# EAGLE schematic ce_hdd_v40 (EAGLE 6.2)
Assembly variants: ACSI, SCSI

## Sheet 1 of 5: IKBD part
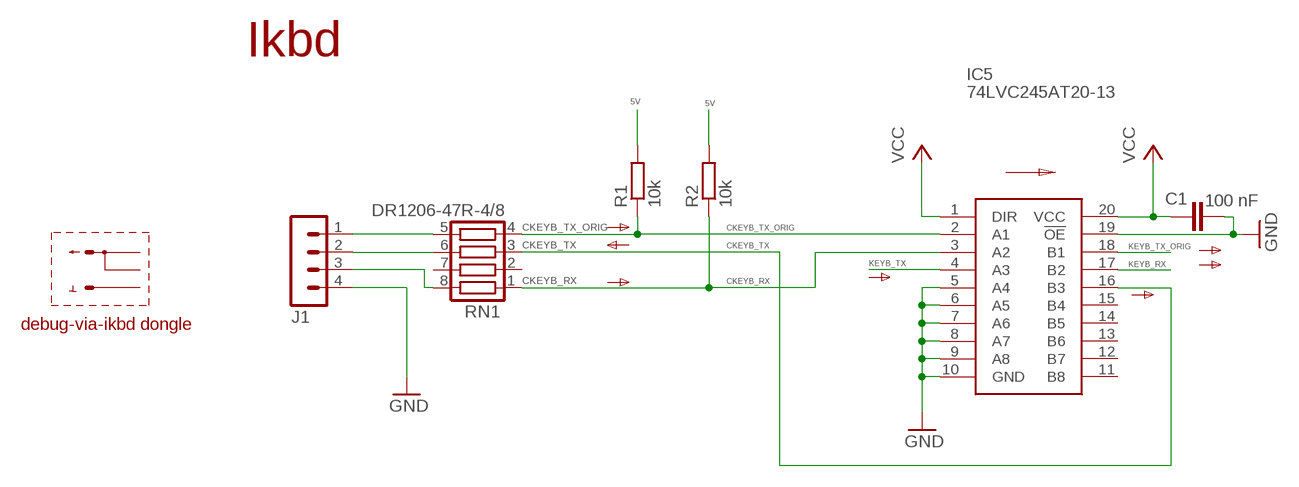
[diagram p0: schematic, sheet 1]

### Parts
C1  100 nF  C-EUC0603  [C0603]
IC5  74LVC245AT20-13  [SOP65P640X120-20N]
J1  MA04-1  [MA04-1]
R1  10k  R-EU_R0603  [R0603]
R2  10k  R-EU_R0603  [R0603]
RN1  DR1206-47R-4/8  CTS742C083  [CTS742C083]

### Nets
5V: R1.2 R2.2 ; also sheet 3,5
CKEYB_RX: IC5.3(A2) R2.1 RN1.1
CKEYB_TX: IC5.16(B3) RN1.3
CKEYB_TX_ORIG: IC5.2(A1) R1.1 RN1.4
GND: C1.1 IC5.5(A4) IC5.6(A5) IC5.7(A6) IC5.8(A7) IC5.9(A8) IC5.10(GND) IC5.19(!OE) J1.4 ; also sheet 2,3,4,5
KEYB_RX: IC5.17(B2) ; also sheet 5
KEYB_TX: IC5.4(A3) ; also sheet 5
KEYB_TX_ORIG: IC5.18(B1) ; also sheet 5
N$21: J1.2 RN1.6
VCC: C1.2 IC5.1(DIR) IC5.20(VCC) ; also sheet 2,4,5
ZKEYB_RX: J1.3 RN1.8
ZKEYB_TX_ORIG: J1.1 RN1.5
Unconnected: IC5.11(B8) IC5.12(B7) IC5.13(B6) IC5.14(B5) IC5.15(B4) RN1.2 RN1.7

### Notes on the sheet
- Ikbd
- debug-via-ikbd dongle

## Sheet 2 of 5: SCSI drivers and termination
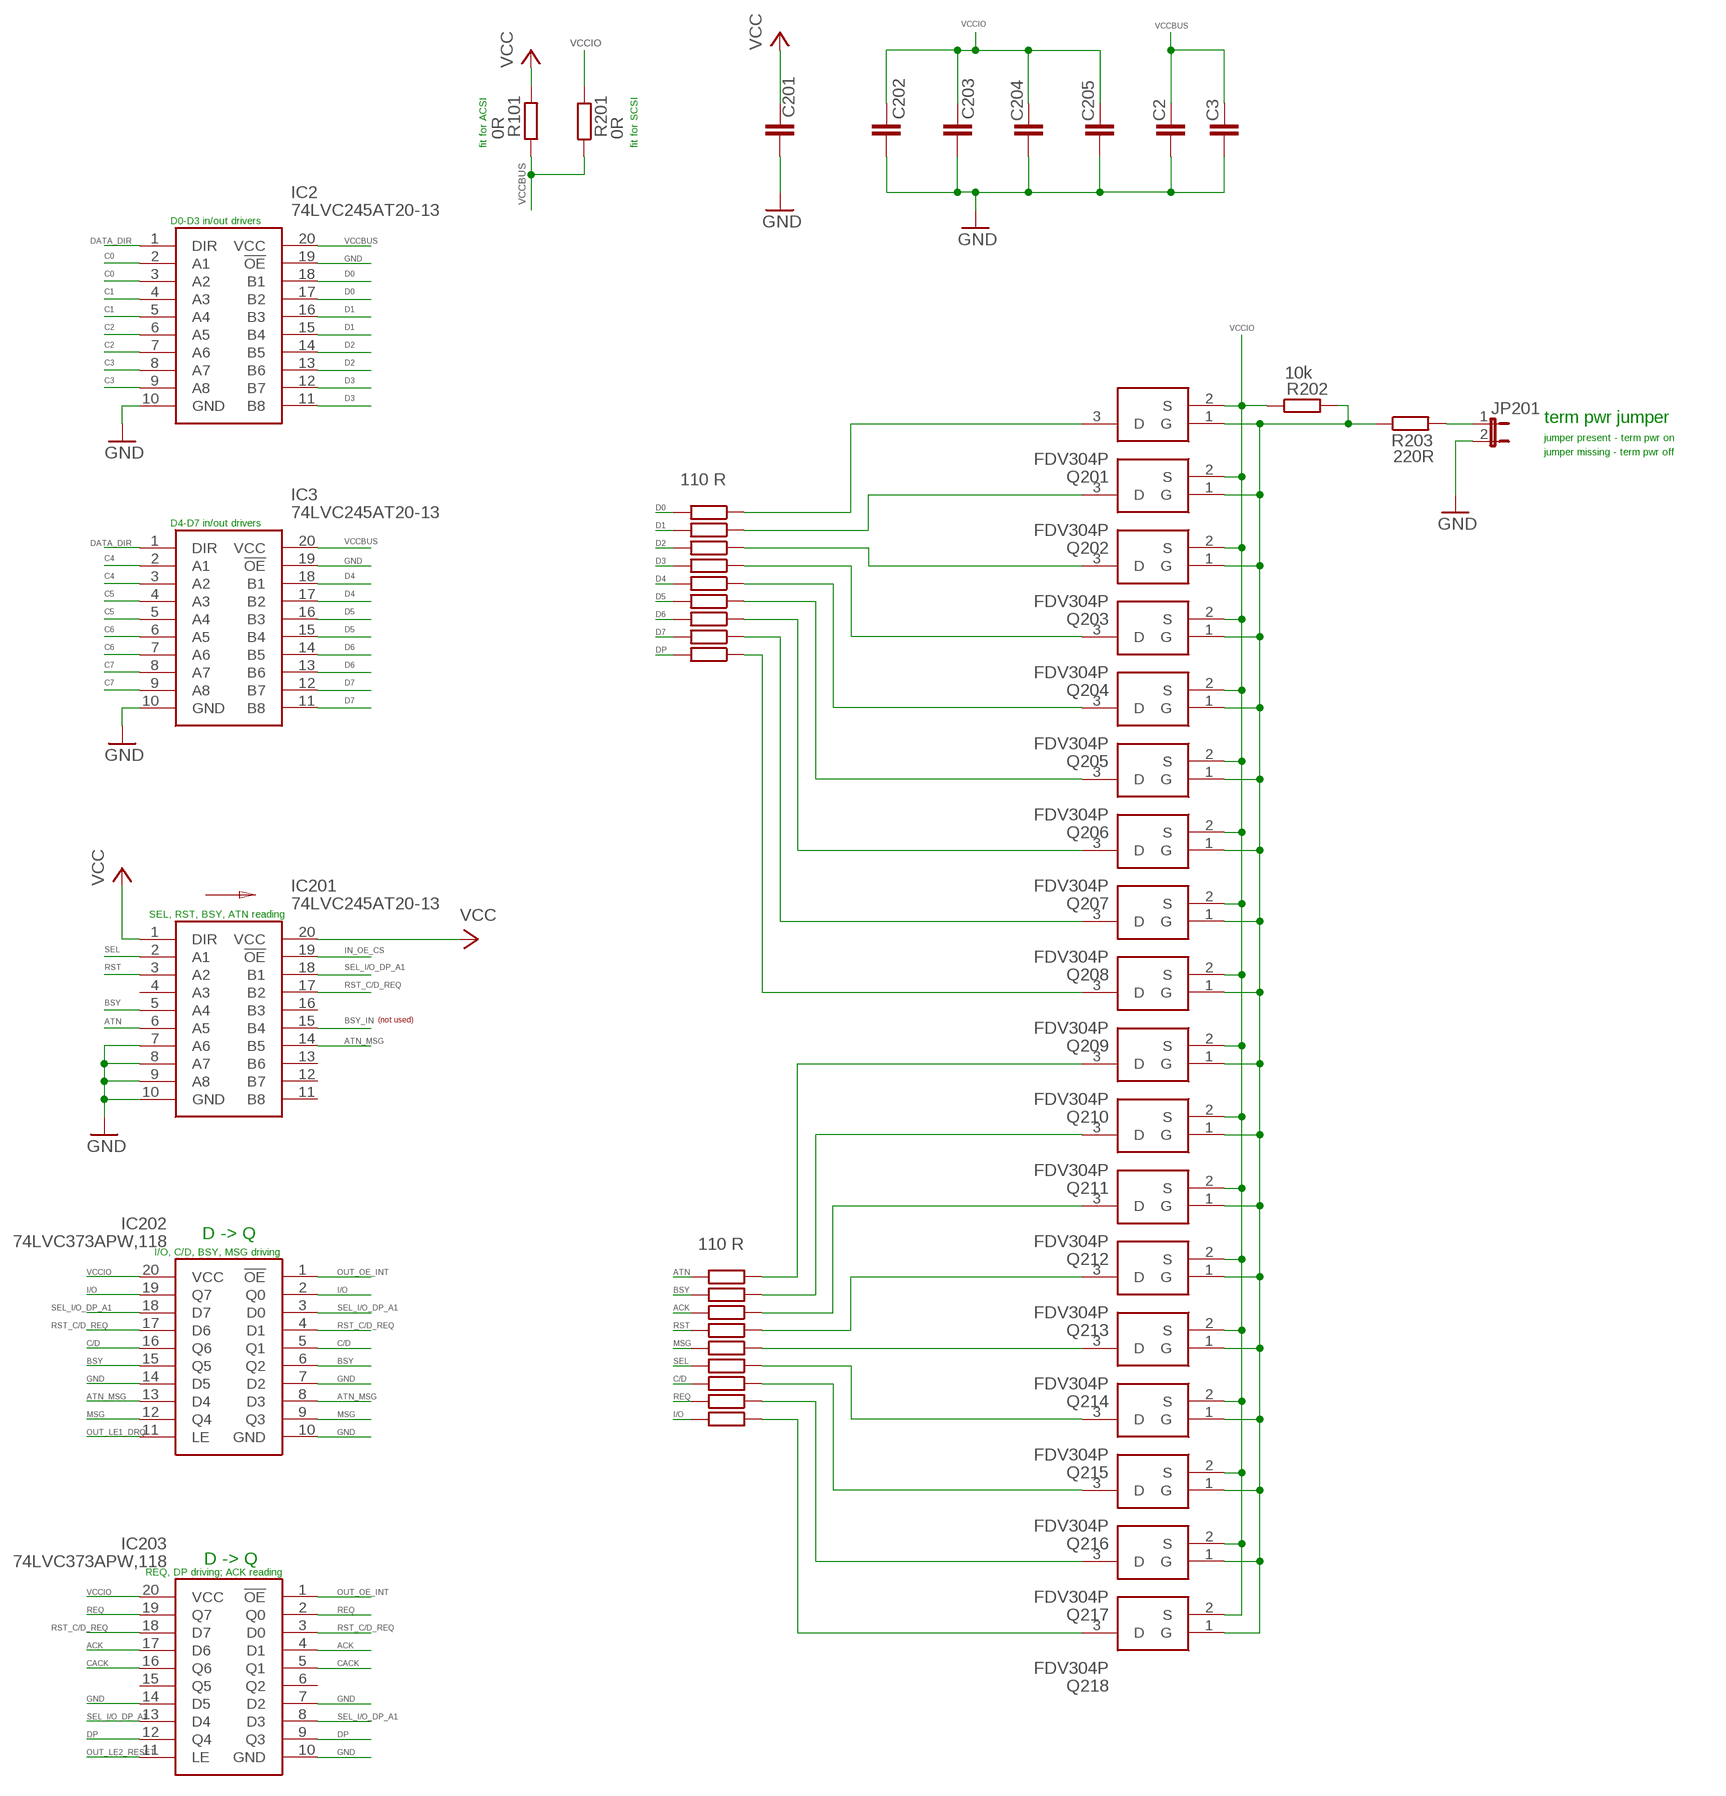
[diagram p1: schematic, sheet 2]

### Parts
C2  100 nF  C-EUC0603  [C0603]
C3  100 nF  C-EUC0603  [C0603]
C201  100 nF  C-EUC0603  [C0603]  (not fitted in variant ACSI)
C202  100 nF  C-EUC0603  [C0603]  (not fitted in variant ACSI)
C203  1 uF  C-EUC0603  [C0603]  (not fitted in variant ACSI)
C204  100 nF  C-EUC0603  [C0603]  (not fitted in variant ACSI)
C205  100 nF  C-EUC0603  [C0603]  (not fitted in variant ACSI)
IC2  74LVC245AT20-13  [SOP65P640X120-20N]
IC3  74LVC245AT20-13  [SOP65P640X120-20N]
IC201  74LVC245AT20-13  [SOP65P640X120-20N]  (not fitted in variant ACSI)
IC202  74LVC373APW,118  [SOP65P640X110-20N]  (not fitted in variant ACSI)
IC203  74LVC373APW,118  [SOP65P640X110-20N]  (not fitted in variant ACSI)
JP201  JP1E  [JP1]  (not fitted in variant ACSI)
Q201  FDV304P  IRLML6401TRPBF  [SOT95P237X112-3N]  (not fitted in variant ACSI)
Q202  FDV304P  IRLML6401TRPBF  [SOT95P237X112-3N]  (not fitted in variant ACSI)
Q203  FDV304P  IRLML6401TRPBF  [SOT95P237X112-3N]  (not fitted in variant ACSI)
Q204  FDV304P  IRLML6401TRPBF  [SOT95P237X112-3N]  (not fitted in variant ACSI)
Q205  FDV304P  IRLML6401TRPBF  [SOT95P237X112-3N]  (not fitted in variant ACSI)
Q206  FDV304P  IRLML6401TRPBF  [SOT95P237X112-3N]  (not fitted in variant ACSI)
Q207  FDV304P  IRLML6401TRPBF  [SOT95P237X112-3N]  (not fitted in variant ACSI)
Q208  FDV304P  IRLML6401TRPBF  [SOT95P237X112-3N]  (not fitted in variant ACSI)
Q209  FDV304P  IRLML6401TRPBF  [SOT95P237X112-3N]  (not fitted in variant ACSI)
Q210  FDV304P  IRLML6401TRPBF  [SOT95P237X112-3N]  (not fitted in variant ACSI)
Q211  FDV304P  IRLML6401TRPBF  [SOT95P237X112-3N]  (not fitted in variant ACSI)
Q212  FDV304P  IRLML6401TRPBF  [SOT95P237X112-3N]  (not fitted in variant ACSI)
Q213  FDV304P  IRLML6401TRPBF  [SOT95P237X112-3N]  (not fitted in variant ACSI)
Q214  FDV304P  IRLML6401TRPBF  [SOT95P237X112-3N]  (not fitted in variant ACSI)
Q215  FDV304P  IRLML6401TRPBF  [SOT95P237X112-3N]  (not fitted in variant ACSI)
Q216  FDV304P  IRLML6401TRPBF  [SOT95P237X112-3N]  (not fitted in variant ACSI)
Q217  FDV304P  IRLML6401TRPBF  [SOT95P237X112-3N]  (not fitted in variant ACSI)
Q218  FDV304P  IRLML6401TRPBF  [SOT95P237X112-3N]  (not fitted in variant ACSI)
R101  0R  R-EU_R0603  [R0603]  (not fitted in variant SCSI)
R201  0R  R-EU_R0603  [R0603]  (not fitted in variant ACSI)
R202  10k  R-EU_R0603  [R0603]  (not fitted in variant ACSI)
R203  220R  R-EU_R0603  [R0603]  (not fitted in variant ACSI)
R204  110 R  R-EU_R0603  [R0603]  (not fitted in variant ACSI)
R205  110 R  R-EU_R0603  [R0603]  (not fitted in variant ACSI)
R206  110 R  R-EU_R0603  [R0603]  (not fitted in variant ACSI)
R207  110 R  R-EU_R0603  [R0603]  (not fitted in variant ACSI)
R208  110 R  R-EU_R0603  [R0603]  (not fitted in variant ACSI)
R209  110 R  R-EU_R0603  [R0603]  (not fitted in variant ACSI)
R210  110 R  R-EU_R0603  [R0603]  (not fitted in variant ACSI)
R211  110 R  R-EU_R0603  [R0603]  (not fitted in variant ACSI)
R212  110 R  R-EU_R0603  [R0603]  (not fitted in variant ACSI)
R213  110 R  R-EU_R0603  [R0603]  (not fitted in variant ACSI)
R214  110 R  R-EU_R0603  [R0603]  (not fitted in variant ACSI)
R215  110 R  R-EU_R0603  [R0603]  (not fitted in variant ACSI)
R216  110 R  R-EU_R0603  [R0603]  (not fitted in variant ACSI)
R217  110 R  R-EU_R0603  [R0603]  (not fitted in variant ACSI)
R218  110 R  R-EU_R0603  [R0603]  (not fitted in variant ACSI)
R219  110 R  R-EU_R0603  [R0603]  (not fitted in variant ACSI)
R220  110 R  R-EU_R0603  [R0603]  (not fitted in variant ACSI)
R221  110 R  R-EU_R0603  [R0603]  (not fitted in variant ACSI)

### Nets
AAAA: Q201.3(D) R204.1
ACK: IC203.4(D1) IC203.17(D6) R215.2 ; also sheet 3
ATN: IC201.6(A5) R213.2 ; also sheet 3
ATN_MSG: IC201.14(B5) IC202.8(D3) IC202.13(D4) ; also sheet 5
BSY: IC201.5(A4) IC202.6(Q2) IC202.15(Q5) R214.2 ; also sheet 3
BSY_IN: IC201.15(B4)
C0: IC2.2(A1) IC2.3(A2) ; also sheet 5
C1: IC2.4(A3) IC2.5(A4) ; also sheet 5
C2: IC2.6(A5) IC2.7(A6) ; also sheet 5
C3: IC2.8(A7) IC2.9(A8) ; also sheet 5
C4: IC3.2(A1) IC3.3(A2) ; also sheet 5
C5: IC3.4(A3) IC3.5(A4) ; also sheet 5
C6: IC3.6(A5) IC3.7(A6) ; also sheet 5
C7: IC3.8(A7) IC3.9(A8) ; also sheet 5
C/D: IC202.5(Q1) IC202.16(Q6) R219.2 ; also sheet 3
CACK: IC203.5(Q1) IC203.16(Q6) ; also sheet 4,5
D0: IC2.17(B2) IC2.18(B1) R204.2 ; also sheet 3,4
D1: IC2.15(B4) IC2.16(B3) R205.2 ; also sheet 3,4
D2: IC2.13(B6) IC2.14(B5) R206.2 ; also sheet 3,4
D3: IC2.11(B8) IC2.12(B7) R207.2 ; also sheet 3,4
D4: IC3.17(B2) IC3.18(B1) R208.2 ; also sheet 3,4
D5: IC3.15(B4) IC3.16(B3) R209.2 ; also sheet 3,4
D6: IC3.13(B6) IC3.14(B5) R210.2 ; also sheet 3,4
D7: IC3.11(B8) IC3.12(B7) R211.2 ; also sheet 3,4
DATA_DIR: IC2.1(DIR) IC3.1(DIR) ; also sheet 5
DP: IC203.9(Q3) IC203.12(Q4) R212.2 ; also sheet 3
GND: C2.2 C3.2 C201.2 C202.2 C203.2 C204.2 C205.2 IC2.10(GND) IC2.19(!OE) IC3.10(GND) IC3.19(!OE) IC201.7(A6) IC201.8(A7) IC201.9(A8) IC201.10(GND) IC202.7(D2) IC202.10(GND) IC202.14(D5) IC203.7(D2) IC203.10(GND) IC203.14(D5) JP201.2 ; also sheet 1,3,4,5
I/O: IC202.2(Q0) IC202.19(Q7) R221.2 ; also sheet 3
IN_OE_CS: IC201.19(!OE) ; also sheet 4,5
MSG: IC202.9(Q3) IC202.12(Q4) R217.2 ; also sheet 3
N$8: JP201.1 R203.2
N$12: Q202.3(D) R205.1
N$13: Q203.3(D) R206.1
N$14: Q204.3(D) R207.1
N$15: Q205.3(D) R208.1
N$18: Q206.3(D) R209.1
N$19: Q207.3(D) R210.1
N$20: Q208.3(D) R211.1
N$22: Q209.3(D) R212.1
N$24: Q210.3(D) R213.1
N$100: Q211.3(D) R214.1
N$101: Q212.3(D) R215.1
N$102: Q213.3(D) R216.1
N$103: Q214.3(D) R217.1
N$104: Q215.3(D) R218.1
N$105: Q216.3(D) R219.1
N$106: Q217.3(D) R220.1
N$107: Q218.3(D) R221.1
OUT_LE1_DRQ: IC202.11(LE) ; also sheet 4,5
OUT_LE2_RESET: IC203.11(LE) ; also sheet 4,5
OUT_OE_INT: IC202.1(!OE) IC203.1(!OE) ; also sheet 4,5
REQ: IC203.2(Q0) IC203.19(Q7) R220.2 ; also sheet 3
RST: IC201.3(A2) R216.2 ; also sheet 3
RST_C/D_REQ: IC201.17(B2) IC202.4(D1) IC202.17(D6) IC203.3(D0) IC203.18(D7) ; also sheet 5
SEL: IC201.2(A1) R218.2 ; also sheet 3
SEL_I/O_DP_A1: IC201.18(B1) IC202.3(D0) IC202.18(D7) IC203.8(D3) IC203.13(D4) ; also sheet 4,5
TP_ON: Q201.1(G) Q202.1(G) Q203.1(G) Q204.1(G) Q205.1(G) Q206.1(G) Q207.1(G) Q208.1(G) Q209.1(G) Q210.1(G) Q211.1(G) Q212.1(G) Q213.1(G) Q214.1(G) Q215.1(G) Q216.1(G) Q217.1(G) Q218.1(G) R202.2 R203.1
VCC: C201.1 IC201.1(DIR) IC201.20(VCC) R101.2 ; also sheet 1,4,5
VCCBUS: C2.1 C3.1 IC2.20(VCC) IC3.20(VCC) R101.1 R201.1
VCCIO: C202.1 C203.1 C204.1 C205.1 IC202.20(VCC) IC203.20(VCC) Q201.2(S) Q202.2(S) Q203.2(S) Q204.2(S) Q205.2(S) Q206.2(S) Q207.2(S) Q208.2(S) Q209.2(S) Q210.2(S) Q211.2(S) Q212.2(S) Q213.2(S) Q214.2(S) Q215.2(S) Q216.2(S) Q217.2(S) Q218.2(S) R201.2 R202.1 ; also sheet 3
Unconnected: IC201.4(A3) IC201.11(B8) IC201.12(B7) IC201.13(B6) IC201.16(B3) IC203.6(Q2) IC203.15(Q5)

### Notes on the sheet
- fit for ACSI | fit for SCSI
- D0-D3 in/out drivers
- term pwr jumper
- jumper present - term pwr on
- jumper missing - term pwr off
- D4-D7 in/out drivers
- SEL, RST, BSY, ATN reading
- (not used)
- D -> Q
- I/O, C/D, BSY, MSG driving
- D -> Q
- REQ, DP driving; ACK reading

## Sheet 3 of 5: SCSI connectors
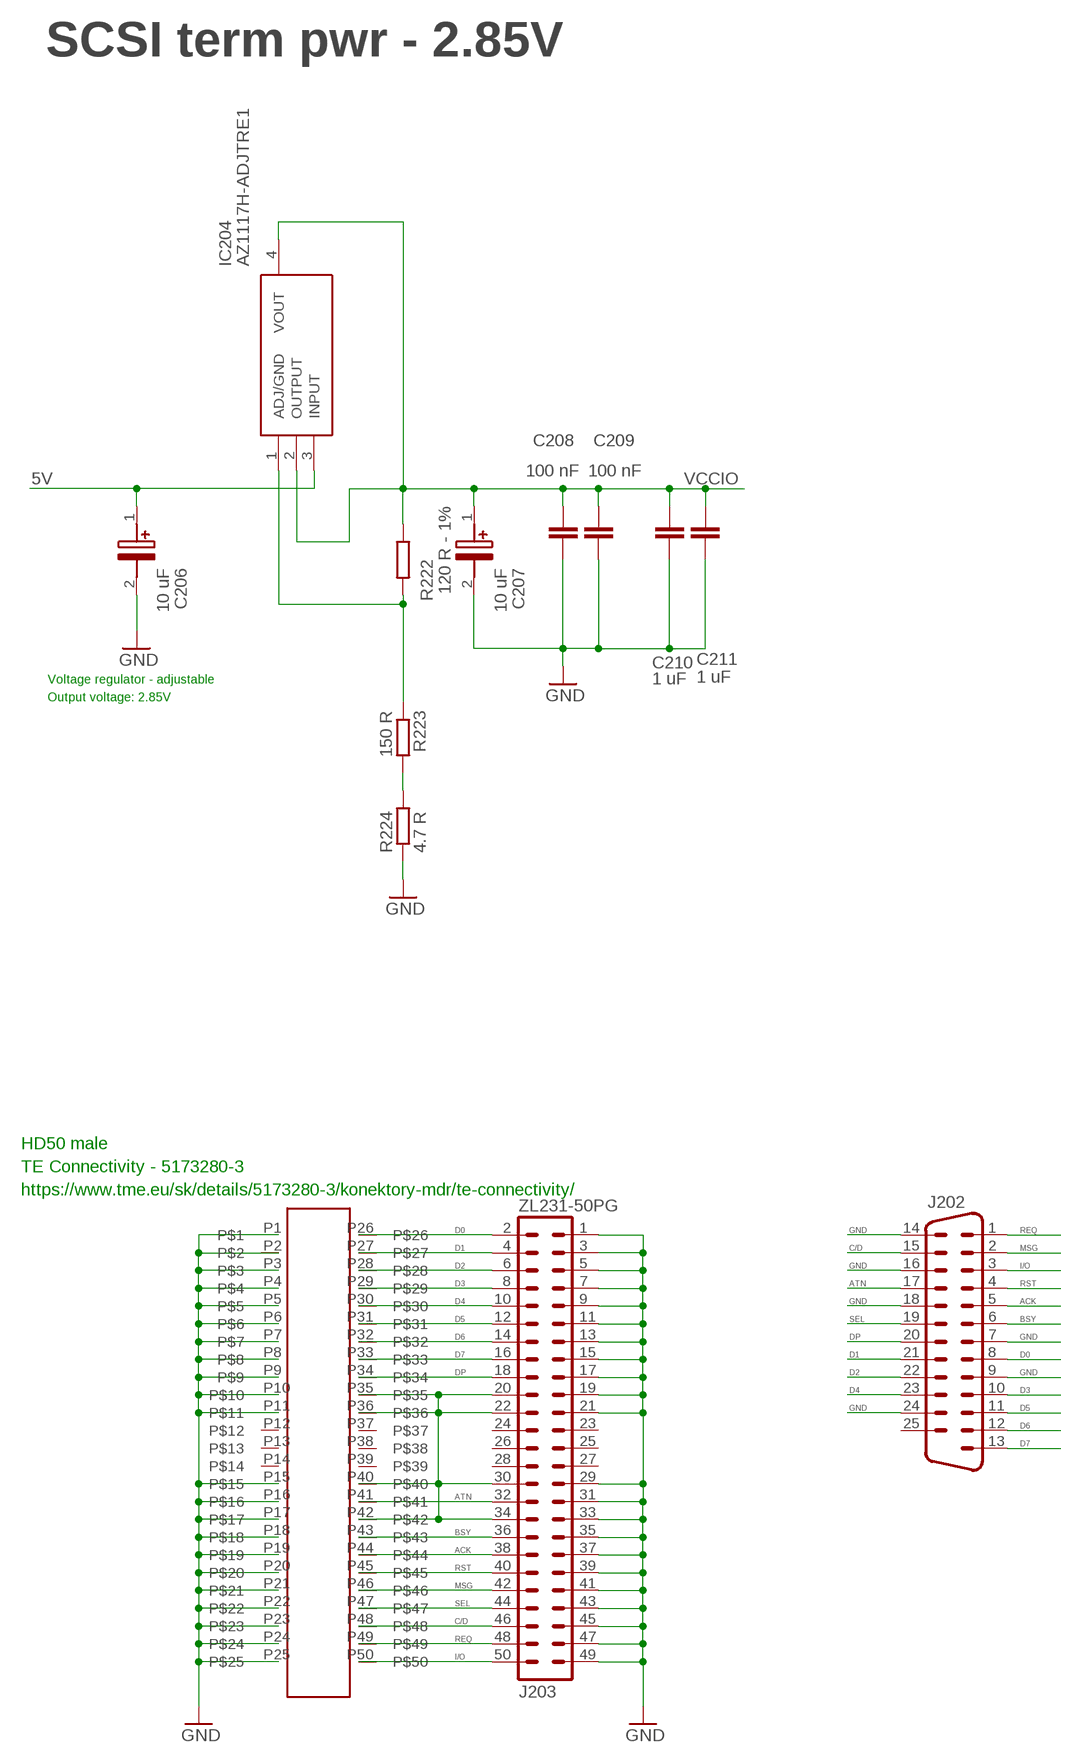
[diagram p2: schematic, sheet 3]

### Parts
C206  10 uF  293D106X9016B2TE3  [CAPPM3528X210N]  (not fitted in variant ACSI)
C207  10 uF  293D106X9016B2TE3  [CAPPM3528X210N]  (not fitted in variant ACSI)
C208  100 nF  C-EUC0603  [C0603]  (not fitted in variant ACSI)
C209  100 nF  C-EUC0603  [C0603]  (not fitted in variant ACSI)
C210  1 uF  C-EUC0603  [C0603]  (not fitted in variant ACSI)
C211  1 uF  C-EUC0603  [C0603]  (not fitted in variant ACSI)
IC204  AZ1117H-ADJTRE1  [SOT230P700X185-4N]  (not fitted in variant ACSI)
J201  TE Connectivity - 5173280-3  HD50_MALE  [HD50_MALE]  (not fitted in variant ACSI)
J202  M25V  [M25V]  (not fitted in variant ACSI)
J203  ZL231-50PG  ML50  [ML50]  (not fitted in variant ACSI)
R222  120 R - 1%  R-EU_R0603  [R0603]  (not fitted in variant ACSI)
R223  150 R  R-EU_R0603  [R0603]  (not fitted in variant ACSI)
R224  4.7 R  R-EU_R0603  [R0603]  (not fitted in variant ACSI)

### Nets
5V: C206.1(+) IC204.3(INPUT) ; also sheet 1,5
ACK: J201.P44 J202.5 J203.38 ; also sheet 2
ATN: J201.P41 J202.17 J203.32 ; also sheet 2
BSY: J201.P43 J202.6 J203.36 ; also sheet 2
C/D: J201.P48 J202.15 J203.46 ; also sheet 2
D0: J201.P26 J202.8 J203.2 ; also sheet 2,4
D1: J201.P27 J202.21 J203.4 ; also sheet 2,4
D2: J201.P28 J202.22 J203.6 ; also sheet 2,4
D3: J201.P29 J202.10 J203.8 ; also sheet 2,4
D4: J201.P30 J202.23 J203.10 ; also sheet 2,4
D5: J201.P31 J202.11 J203.12 ; also sheet 2,4
D6: J201.P32 J202.12 J203.14 ; also sheet 2,4
D7: J201.P33 J202.13 J203.16 ; also sheet 2,4
DP: J201.P34 J202.20 J203.18 ; also sheet 2
GND: C206.2(-) C207.2(-) C208.2 C209.2 C210.2 C211.2 J201.P1 J201.P2 J201.P3 J201.P4 J201.P5 J201.P6 J201.P7 J201.P8 J201.P9 J201.P10 J201.P11 J201.P15 J201.P16 J201.P17 J201.P18 J201.P19 J201.P20 J201.P21 J201.P22 J201.P23 J201.P24 J201.P25 J201.P35 J201.P36 J201.P40 J201.P42 J202.7 J202.9 J202.14 J202.16 J202.18 J202.24 J203.1 J203.3 J203.5 J203.7 J203.9 J203.11 J203.13 J203.15 J203.17 J203.19 J203.20 J203.21 J203.22 J203.29 J203.30 J203.31 J203.33 J203.34 J203.35 J203.37 J203.39 J203.41 J203.43 J203.45 J203.47 J203.49 R224.1 ; also sheet 1,2,4,5
I/O: J201.P50 J202.3 J203.50 ; also sheet 2
MSG: J201.P46 J202.2 J203.42 ; also sheet 2
N$5: R223.2 R224.2
N$30: IC204.1(ADJ/GND) R222.2 R223.1
REQ: J201.P49 J202.1 J203.48 ; also sheet 2
RST: J201.P45 J202.4 J203.40 ; also sheet 2
SEL: J201.P47 J202.19 J203.44 ; also sheet 2
VCCIO: C207.1(+) C208.1 C209.1 C210.1 C211.1 IC204.2(OUTPUT) IC204.4(VOUT) R222.1 ; also sheet 2
Unconnected: J201.P12 J201.P13 J201.P14 J201.P37 J201.P38 J201.P39 J202.25 J203.23 J203.24 J203.25 J203.26 J203.27 J203.28

### Notes on the sheet
- SCSI term pwr - 2.85V
- Voltage regulator - adjustable
- Output voltage: 2.85V
- HD50 male
- TE Connectivity - 5173280-3
- https://www.tme.eu/sk/details/5173280-3/konektory-mdr/te-connectivity/

## Sheet 4 of 5: ACSI driver and connector
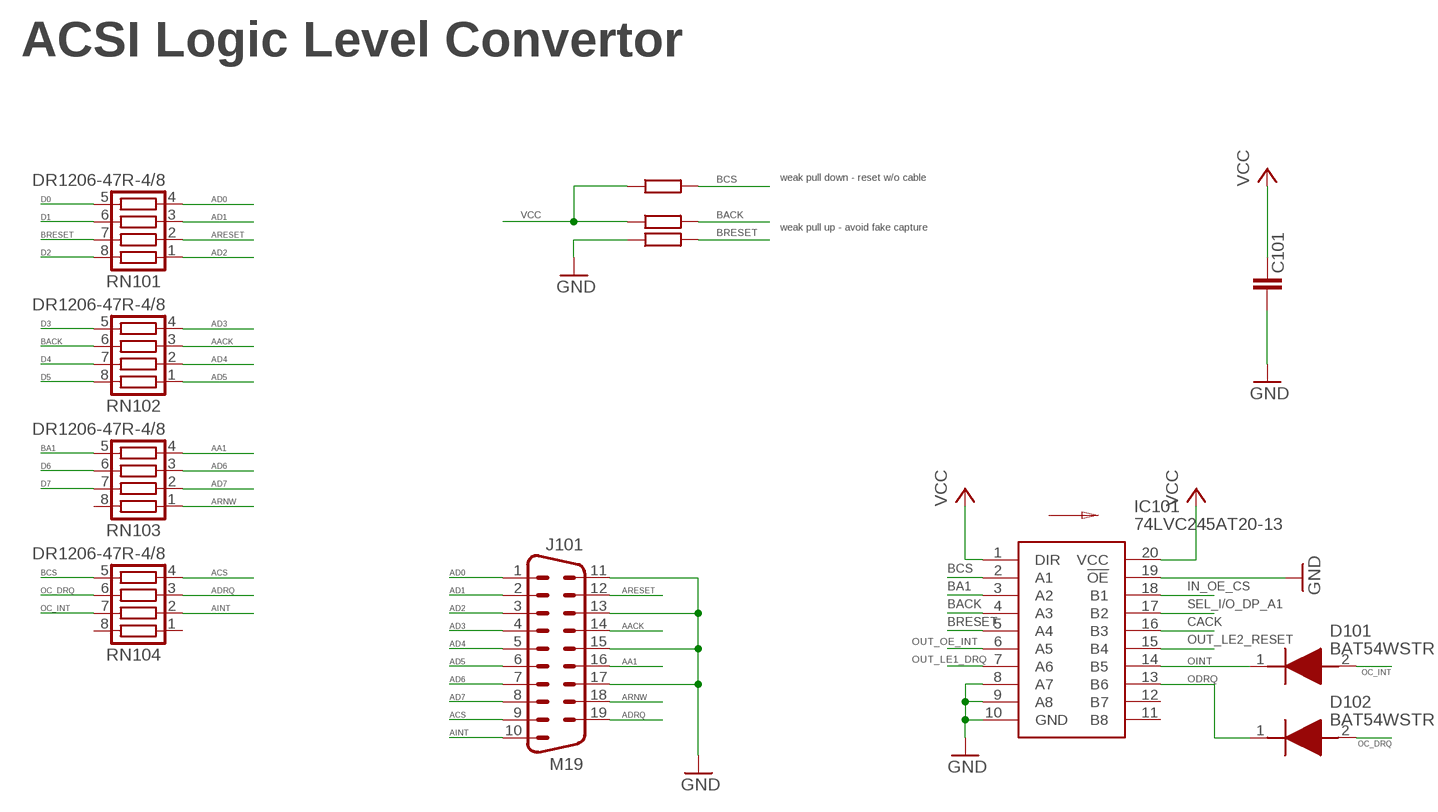
[diagram p3: schematic, sheet 4]

### Parts
C101  1 uF  C-EUC0603  [C0603]  (not fitted in variant SCSI)
D101  BAT54WSTR  [SOD2613X100N]  (not fitted in variant SCSI)
D102  BAT54WSTR  [SOD2613X100N]  (not fitted in variant SCSI)
IC101  74LVC245AT20-13  [SOP65P640X120-20N]  (not fitted in variant SCSI)
J101  M19  [M19]  (not fitted in variant SCSI)
R102  10k  R-EU_R0603  [R0603]  (not fitted in variant SCSI)
R103  10k  R-EU_R0603  [R0603]  (not fitted in variant SCSI)
R104  10k  R-EU_R0603  [R0603]  (not fitted in variant SCSI)
RN101  DR1206-47R-4/8  CTS742C083  [CTS742C083]  (not fitted in variant SCSI)
RN102  DR1206-47R-4/8  CTS742C083  [CTS742C083]  (not fitted in variant SCSI)
RN103  DR1206-47R-4/8  CTS742C083  [CTS742C083]  (not fitted in variant SCSI)
RN104  DR1206-47R-4/8  CTS742C083  [CTS742C083]  (not fitted in variant SCSI)

### Nets
AA1: J101.16 RN103.4
AACK: J101.14 RN102.3
ACS: J101.9 RN104.4
AD0: J101.1 RN101.4
AD1: J101.2 RN101.3
AD2: J101.3 RN101.1
AD3: J101.4 RN102.4
AD4: J101.5 RN102.2
AD5: J101.6 RN102.1
AD6: J101.7 RN103.3
AD7: J101.8 RN103.2
ADRQ: J101.19 RN104.3
AINT: J101.10 RN104.2
ARESET: J101.12 RN101.2
ARNW: J101.18 RN103.1
BA1: IC101.3(A2) RN103.5
BACK: IC101.4(A3) R103.2 RN102.6
BCS: IC101.2(A1) R102.2 RN104.5
BRESET: IC101.5(A4) R104.2 RN101.7
CACK: IC101.16(B3) ; also sheet 2,5
D0: RN101.5 ; also sheet 2,3
D1: RN101.6 ; also sheet 2,3
D2: RN101.8 ; also sheet 2,3
D3: RN102.5 ; also sheet 2,3
D4: RN102.7 ; also sheet 2,3
D5: RN102.8 ; also sheet 2,3
D6: RN103.6 ; also sheet 2,3
D7: RN103.7 ; also sheet 2,3
GND: C101.2 IC101.8(A7) IC101.9(A8) IC101.10(GND) IC101.19(!OE) J101.11 J101.13 J101.15 J101.17 R104.1 ; also sheet 1,2,3,5
IN_OE_CS: IC101.18(B1) ; also sheet 2,5
OC_DRQ: D102.2(A) RN104.6
OC_INT: D101.2(A) RN104.7
ODRQ: D102.1(K) IC101.13(B6)
OINT: D101.1(K) IC101.14(B5)
OUT_LE1_DRQ: IC101.7(A6) ; also sheet 2,5
OUT_LE2_RESET: IC101.15(B4) ; also sheet 2,5
OUT_OE_INT: IC101.6(A5) ; also sheet 2,5
SEL_I/O_DP_A1: IC101.17(B2) ; also sheet 2,5
VCC: C101.1 IC101.1(DIR) IC101.20(VCC) R102.1 R103.1 ; also sheet 1,2,5
Unconnected: IC101.11(B8) IC101.12(B7) RN103.8 RN104.1 RN104.8

### Notes on the sheet
- ACSI Logic Level Convertor
- weak pull down - reset w/o cable
- weak pull up - avoid fake capture

## Sheet 5 of 5: PICO, power, LEDs
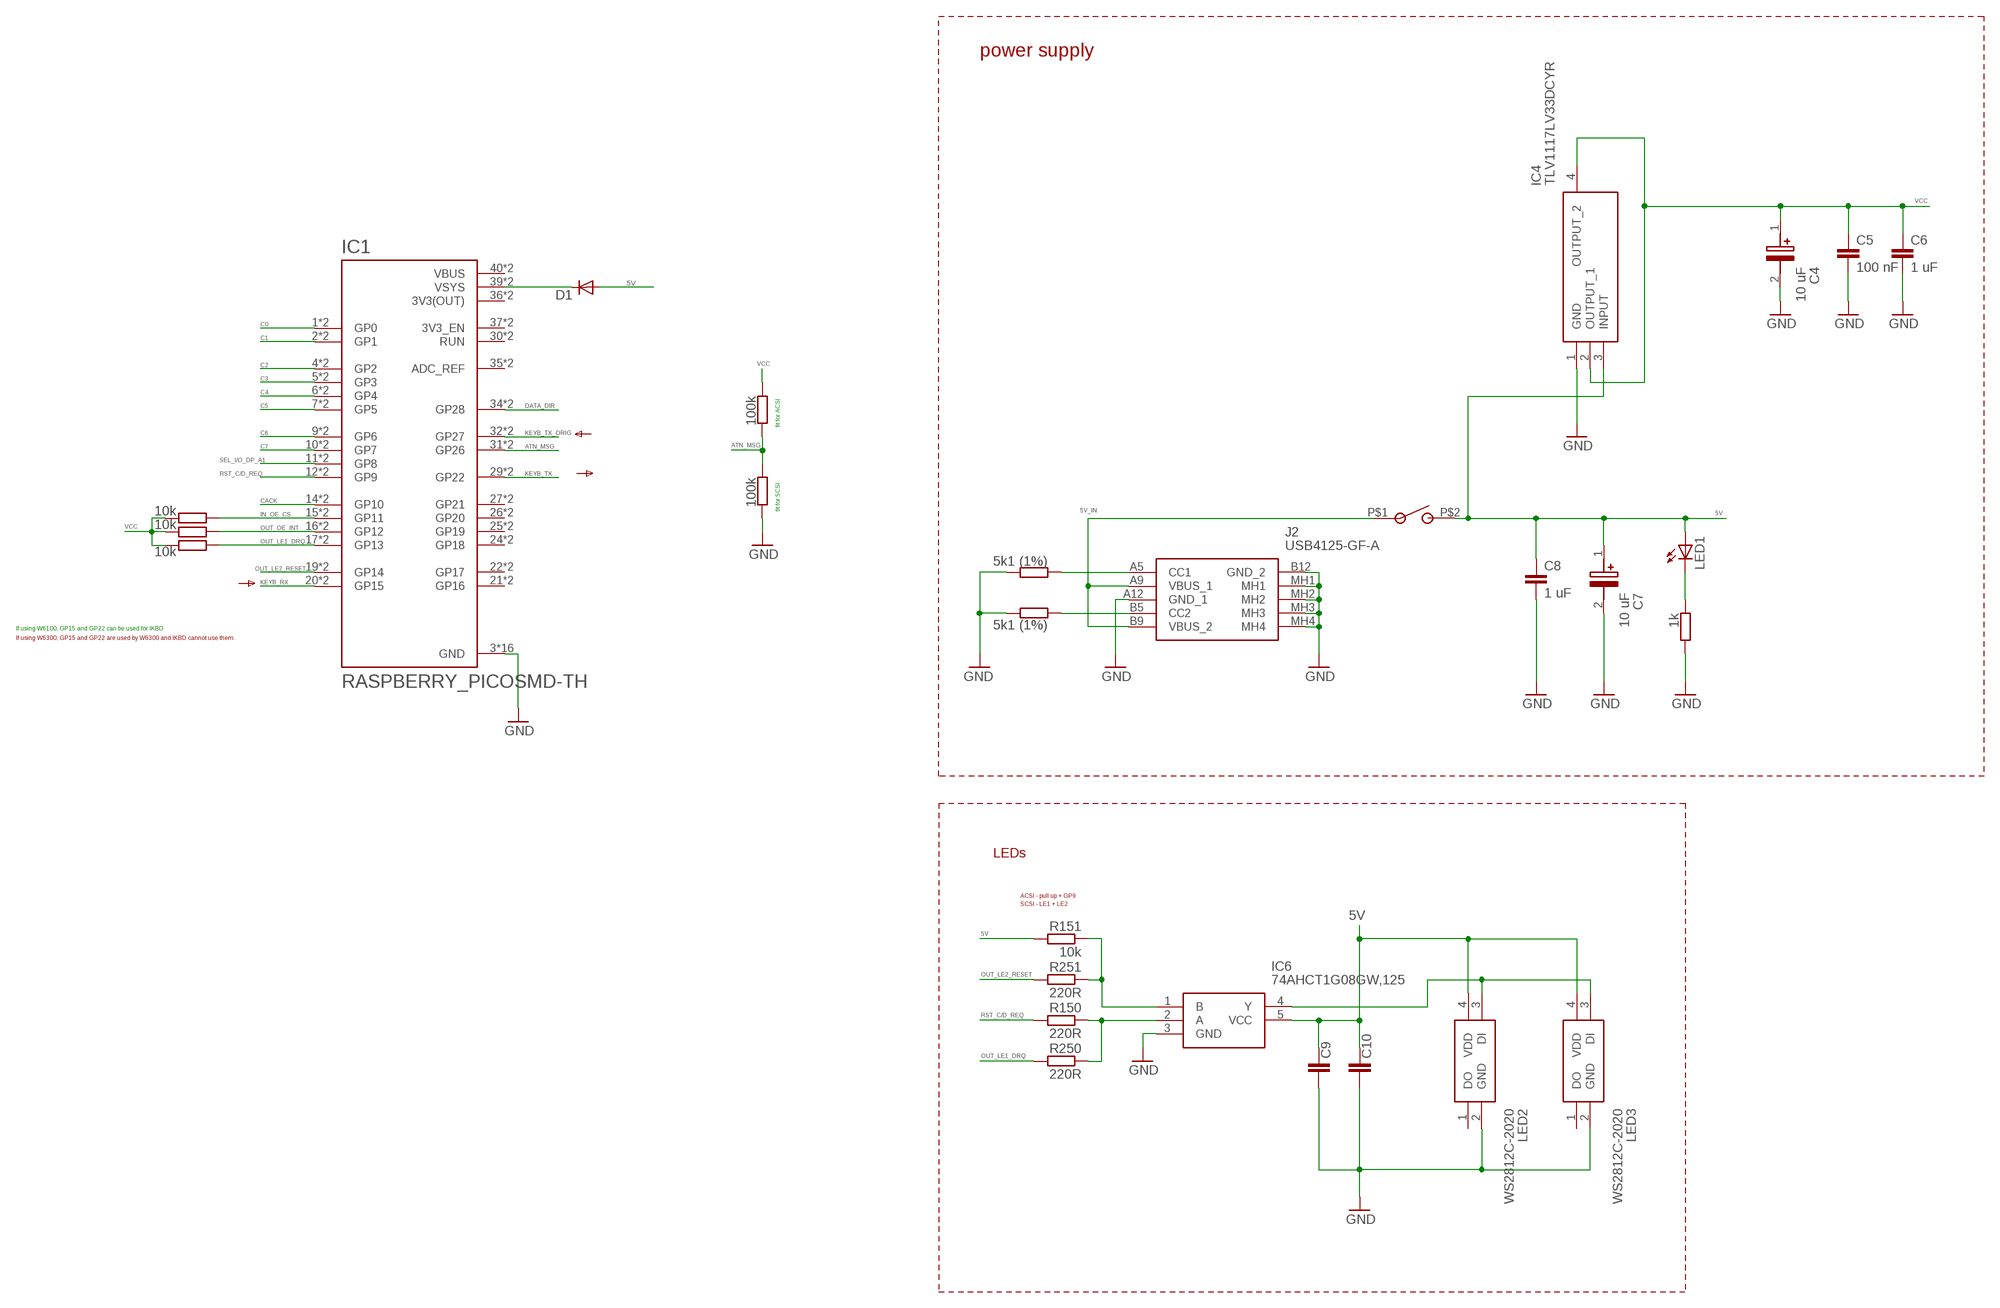
[diagram p4: schematic, sheet 5]

### Parts
C4  10 uF  293D106X9016B2TE3  [CAPPM3528X210N]
C5  100 nF  C-EUC0603  [C0603]
C6  1 uF  C-EUC0603  [C0603]
C7  10 uF  293D106X9016B2TE3  [CAPPM3528X210N]
C8  1 uF  C-EUC0603  [C0603]
C9  100 nF  C-EUC0603  [C0603]
C10  100 nF  C-EUC0603  [C0603]
D1  SK110-DIO  DIODE-DO214AC  [DO214AC]
IC1  RASPBERRY_PICOSMD-TH  [PICO-PKG]
IC4  TLV1117LV33DCYR  [SOT230P700X180-4N]
IC6  74AHCT1G08GW,125  [SOT65P212X110-5N]
J2  USB4125-GF-A  [USB4125GFA]
LED1  LEDSML0603  [SML0603]
LED2  WS2812C-2020  [WS2812C2020]
LED3  WS2812C-2020  [WS2812C2020]
R3  5k1 (1%)  R-EU_R0603  [R0603]
R4  5k1 (1%)  R-EU_R0603  [R0603]
R5  1k  R-EU_R0603  [R0603]
R6  10k  R-EU_R0603  [R0603]
R7  10k  R-EU_R0603  [R0603]
R8  10k  R-EU_R0603  [R0603]
R125  100k  R-EU_R0603  [R0603]  (not fitted in variant SCSI)
R150  220R  R-EU_R0603  [R0603]  (not fitted in variant SCSI)
R151  10k  R-EU_R0603  [R0603]  (not fitted in variant SCSI)
R225  100k  R-EU_R0603  [R0603]  (not fitted in variant ACSI)
R250  220R  R-EU_R0603  [R0603]  (not fitted in variant ACSI)
R251  220R  R-EU_R0603  [R0603]  (not fitted in variant ACSI)
SW1  SMSR-1  [SMRS-1]

### Nets
5V: C7.1(+) C8.1 C9.1 C10.1 D1.A IC4.3(INPUT) IC6.5(VCC) LED1.A LED2.4(VDD) LED3.4(VDD) R151.2 SW1.P$2 ; also sheet 1,3
5V_IN: J2.A9(VBUS_1) J2.B9(VBUS_2) SW1.P$1
ATN_MSG: IC1.31(GP26) IC1.P$31(GP26) R125.2 R225.1 ; also sheet 2
C0: IC1.1(GP0) IC1.P$1(GP0) ; also sheet 2
C1: IC1.2(GP1) IC1.P$2(GP1) ; also sheet 2
C2: IC1.4(GP2) IC1.P$4(GP2) ; also sheet 2
C3: IC1.5(GP3) IC1.P$5(GP3) ; also sheet 2
C4: IC1.6(GP4) IC1.P$6(GP4) ; also sheet 2
C5: IC1.7(GP5) IC1.P$7(GP5) ; also sheet 2
C6: IC1.9(GP6) IC1.P$9(GP6) ; also sheet 2
C7: IC1.10(GP7) IC1.P$10(GP7) ; also sheet 2
CACK: IC1.14(GP10) IC1.P$14(GP10) ; also sheet 2,4
DATA_DIR: IC1.34(GP28) IC1.P$34(GP28) ; also sheet 2
GND: C4.2(-) C5.2 C6.2 C7.2(-) C8.2 C9.2 C10.2 IC1.3(GND) IC1.8(GND) IC1.13(GND) IC1.18(GND) IC1.23(GND) IC1.28(GND) IC1.33(GND) IC1.38(GND) IC1.P$3(GND) IC1.P$8(GND) IC1.P$13(GND) IC1.P$18(GND) IC1.P$23(GND) IC1.P$28(GND) IC1.P$33(GND) IC1.P$38(GND) IC4.1(GND) IC6.3(GND) J2.A12(GND_1) J2.B12(GND_2) J2.MH1 J2.MH2 J2.MH3 J2.MH4 LED2.2(GND) LED3.2(GND) R3.2 R4.2 R5.2 R225.2 ; also sheet 1,2,3,4
IN_OE_CS: IC1.15(GP11) IC1.P$15(GP11) R6.2 ; also sheet 2,4
KEYB_RX: IC1.20(GP15) IC1.P$20(GP15) ; also sheet 1
KEYB_TX: IC1.29(GP22) IC1.P$29(GP22) ; also sheet 1
KEYB_TX_ORIG: IC1.32(GP27) IC1.P$32(GP27) ; also sheet 1
N$1: J2.B5(CC2) R4.1
N$2: J2.A5(CC1) R3.1
N$3: IC6.2(A) R150.1 R250.1
N$4: IC6.1(B) R151.1 R251.1
N$6: LED1.C R5.1
N$7: IC6.4(Y) LED2.3(DI) LED3.3(DI)
N$26: D1.C IC1.39(VSYS) IC1.P$39(VSYS)
OUT_LE1_DRQ: IC1.17(GP13) IC1.P$17(GP13) R8.2 R250.2 ; also sheet 2,4
OUT_LE2_RESET: IC1.19(GP14) IC1.P$19(GP14) R251.2 ; also sheet 2,4
OUT_OE_INT: IC1.16(GP12) IC1.P$16(GP12) R7.2 ; also sheet 2,4
RST_C/D_REQ: IC1.12(GP9) IC1.P$12(GP9) R150.2 ; also sheet 2
SEL_I/O_DP_A1: IC1.11(GP8) IC1.P$11(GP8) ; also sheet 2,4
VCC: C4.1(+) C5.1 C6.1 IC4.2(OUTPUT_1) IC4.4(OUTPUT_2) R6.1 R7.1 R8.1 R125.1 ; also sheet 1,2,4
Unconnected: IC1.21(GP16) IC1.22(GP17) IC1.24(GP18) IC1.25(GP19) IC1.26(GP20) IC1.27(GP21) IC1.30(RUN) IC1.35(ADC_REF) IC1.37(3V3_EN) IC1.P$21(GP16) IC1.P$22(GP17) IC1.P$24(GP18) IC1.P$25(GP19) IC1.P$26(GP20) IC1.P$27(GP21) IC1.P$30(RUN) IC1.P$35(ADC_REF) IC1.P$37(3V3_EN) LED2.1(DO) LED3.1(DO)

### Notes on the sheet
- power supply
- fit for ACSI
- fit for SCSI
- If using W6100, GP15 and GP22 can be used for IKBD
- If using W6300, GP15 and GP22 are used by W6300 and IKBD cannot use them.
- LEDs
- ACSI - pull up + GP9
- SCSI - LE1 + LE2

## Power pins joined to a net without a drawn wire
3V3(OUT): IC1.36(3V3(OUT)) IC1.P$36(3V3(OUT))
VBUS: IC1.40(VBUS) IC1.P$40(VBUS)

## Library data of the parts
C1-C3 C5 C6 C8-C10 C101 C201-C205 C208-C211 = rcl:C-EU: CAPACITOR, European symbol
C4 C7 C206 C207 = 293D106X9016B2TE3:293D106X9016B2TE3: Solid Tantalum Surface Mount Chip Capacitors TANTAMOUNT(TM), Molded Case, Standard Industrial Grade Source: Datasheet <http://www.vishay.com/docs/40002/293d.pdf>; DESCRIPTION: Solid Tantalum Surface Mount Chip Capacitors TANTAMOUNT(TM), Molded Case, Standard Industrial Grade; HEIGHT: 2.1mm; MANUFACTURER_NAME: Vishay; MANUFACTURER_PART_NUMBER: 293D106X9016B2TE3
D1 = diode:DIODE-: DIODE
D101 D102 = BAT54WSTR:BAT54WSTR: DIODE SCHOTTKY 30V 200MA SOD323 Source: Datasheet <http://www.smc-diodes.com/propdf/BAT54WS N0714 REV.D.pdf>; DESCRIPTION: DIODE SCHOTTKY 30V 200MA SOD323; HEIGHT: 1mm; MANUFACTURER_NAME: SMC Diode Solutions; MANUFACTURER_PART_NUMBER: BAT54WSTR
IC1 = RpiPico:RASPBERRY_PICO: Raspberry Pi Pico
IC2 IC3 IC5 IC101 IC201 = 74LVC245AT20-13:74LVC245AT20-13: Bus Transceivers Octal Buffer Trans 3-State Outputs Source: Datasheet <https://www.diodes.com/assets/Datasheets/74LVC245A.pdf>; DESCRIPTION: Bus Transceivers Octal Buffer Trans 3-State Outputs; HEIGHT: 1.2mm; MANUFACTURER_NAME: Diodes Incorporated; MANUFACTURER_PART_NUMBER: 74LVC245AT20-13
IC4 = TLV1117LV33DCYR:TLV1117LV33DCYR: 1-A, Positive Fixed Voltage, Low-Dropout Regulator Source: Datasheet <http://www.ti.com/lit/gpn/tlv1117lv>; DESCRIPTION: 1-A, Positive Fixed Voltage, Low-Dropout Regulator; HEIGHT: 1.8mm; MANUFACTURER_NAME: Texas Instruments; MANUFACTURER_PART_NUMBER: TLV1117LV33DCYR
IC6 = 74AHCT1G08GW_125:74AHCT1G08GW,125: 74AHC(T)1G08 - 2-input AND gate@en-us Source: Datasheet <https://assets.nexperia.com/documents/data-sheet/74AHC_AHCT1G08.pdf>; DESCRIPTION: 74AHC(T)1G08 - 2-input AND gate@en-us; HEIGHT: 1.1mm; MANUFACTURER_NAME: Nexperia; MANUFACTURER_PART_NUMBER: 74AHCT1G08GW,125
IC202 IC203 = 74LVC373APW_118:74LVC373APW,118: 74LVC373A - Octal D-type transparent latch with 5 V tolerant inputs/outputs; 3-State@en-us Source: Datasheet <https://assets.nexperia.com/documents/data-sheet/74LVC373A.pdf>; DESCRIPTION: 74LVC373A - Octal D-type transparent latch with 5 V tolerant inputs/outputs; 3-State@en-us; HEIGHT: 1.1mm; MANUFACTURER_NAME: Nexperia; MANUFACTURER_PART_NUMBER: 74LVC373APW,118
IC204 = AZ1117H-ADJTRE1:AZ1117H-ADJTRE1: DiodesZetex AZ1117H-ADJTRE1, LDO Voltage Regulator, Adjustable 1A, 1.25 12 V 2%, 3+Tab-Pin SOT-223 Source: Datasheet <https://www.diodes.com//assets/Datasheets/products_inactive_data/AZ1117.pdf>; DESCRIPTION: DiodesZetex AZ1117H-ADJTRE1, LDO Voltage Regulator, Adjustable 1A, 1.25 12 V 2%, 3+Tab-Pin SOT-223; HEIGHT: 1.85mm; MANUFACTURER_NAME: Diodes Incorporated; MANUFACTURER_PART_NUMBER: AZ1117H-ADJTRE1
J1 = con-lstb:MA04-1: PIN HEADER; OC_FARNELL: unknown; OC_NEWARK: unknown
J2 = USB4125-GF-A:USB4125-GF-A: USB-C (USB TYPE-C) Receptacle Connector 24 (6+18 Dummy) Position Surface Mount, Right Angle; Through Hole Source: Datasheet <https://gct.co/files/drawings/usb4125.pdf?v=f2858e04-a173-4b74-b17f-8f865ddc3728>; DESCRIPTION: USB-C (USB TYPE-C) Receptacle Connector 24 (6+18 Dummy) Position Surface Mount, Right Angle; Through Hole; HEIGHT: 3.41mm; MANUFACTURER_NAME: GCT (GLOBAL CONNECTOR TECHNOLOGY); MANUFACTURER_PART_NUMBER: USB4125-GF-A
J101 = con_subd19:M19
J201 = scsi_falcon:HD50_MALE
J202 = con-subd:M25: SUB-D; OC_FARNELL: unknown; OC_NEWARK: unknown
J203 = con-harting-ml:ML50: HARTING; OC_FARNELL: unknown; OC_NEWARK: unknown
JP201 = jumper:JP1E: JUMPER
LED1 = led:LED: LED OSRAM: - CHIPLED LG R971, LG N971, LY N971, LG Q971, LY Q971, LO R971, LY R971 LH N974, LH R974 LS Q976, LO Q976, LY Q976 LO Q996 - Hyper CHIPLED LW Q18S LB Q993, LB Q99A, LB R99A - SideLED LS A670, LO A670, LY A670, LG A670, LP A670 LB A673, LV A673, LT A673, LW A673 LH A674 LY A675 LS A676, LA A676, LO A676, LY A676, LW A676 LS A679, LY A679, LG A679 - Hyper Micro SIDELED® LS Y876, LA Y876, LO Y876, LY Y876 LT Y87S - SmartLED LW L88C, LW L88S LB L89C, LB L89S, LG L890 LS L89K, LO L89K, LY L89K LS L896, LA L896, LO L896, LY L896 - TOPLED LS T670, LO T670, LY T670, LG T670, LP T670 LSG T670, LSP T670, LSY T670, LOP T670, LYG T670 LG T671, LOG T671, LSG T671 LB T673, LV T673, LT T673, LW T673 LH T674 LS T676, LA T676, LO T676, LY T676, LB T676, LH T676, LSB T676, LW T676 LB T67C, LV T67C, LT T67C, LS T67K, LO T67K, LY T67K, LW E67C LS E67B, LA E67B, LO E67B, LY E67B, LB E67C, LV E67C, LT E67C LW T67C LS T679, LY T679, LG T679 LS T770, LO T770, LY T770, LG T770, LP T770 LB T773, LV T773, LT T773, LW T773 LH T774 LS E675, LA E675, LY E675, LS T675 LS T776, LA T776, LO T776, LY T776, LB T776 LHGB T686 LT T68C, LB T68C - Hyper Mini TOPLED® LB M676 - Mini TOPLED Santana® LG M470 LS M47K, LO M47K, LY M47K Source: http://www.osram.convergy.de LUXEON: - LUMILED® LXK2-PW12-R00, LXK2-PW12-S00, LXK2-PW14-U00, LXK2-PW14-V00 LXK2-PM12-R00, LXK2-PM12-S00, LXK2-PM14-U00 LXK2-PE12-Q00, LXK2-PE12-R00, LXK2-PE12-S00, LXK2-PE14-T00, LXK2-PE14-U00 LXK2-PB12-K00, LXK2-PB12-L00, LXK2-PB12-M00, LXK2-PB14-N00, LXK2-PB14-P00, LXK2-PB14-Q00 LXK2-PR12-L00, LXK2-PR12-M00, LXK2-PR14-Q00, LXK2-PR14-R00 LXK2-PD12-Q00, LXK2-PD12-R00, LXK2-PD12-S00 LXK2-PH12-R00, LXK2-PH12-S00 LXK2-PL12-P00, LXK2-PL12-Q00, LXK2-PL12-R00 Source: www.luxeon.com KINGBRIGHT: KA-3528ASYC Source: www.kingbright.com
LED2 LED3 = WS2812C-2020:WS2812C-2020: Intelligent control LED integrated light source Source: Datasheet <http://www.world-semi.com/DownLoadFile/139>; DESCRIPTION: Intelligent control LED integrated light source; HEIGHT: 0.84mm; MANUFACTURER_NAME: Worldsemi; MANUFACTURER_PART_NUMBER: WS2812C-2020
Q201-Q218 = IRLML6401TRPBF:IRLML6401TRPBF: INFINEON - IRLML6401TRPBF - MOSFET, P, MICRO3 Source: Datasheet <https://www.infineon.com/dgdl/irlml6401pbf.pdf?fileId=5546d462533600a401535668b96d2634>; DESCRIPTION: INFINEON - IRLML6401TRPBF - MOSFET, P, MICRO3; HEIGHT: 1.12mm; MANUFACTURER_NAME: Infineon; MANUFACTURER_PART_NUMBER: IRLML6401TRPBF
R1-R8 R101-R104 R125 R150 R151 R201-R225 R250 R251 = rcl:R-EU_: RESISTOR, European symbol
RN1 RN101-RN104 = resistor-net:CTS742C083: Chip Resistor Array 4 Single Resistor Source: http://www.ctscorp.com/components/Datasheets/CTSChipArrayDs.pdf; OC_FARNELL: unknown; OC_NEWARK: unknown
SW1 = ce_fdd_v40:SMSR-1